# Altium schematic sheet Connector-Sheet.SchDoc
size 420 x 297 mm; SheetNumber: 25; SheetTotal: 25
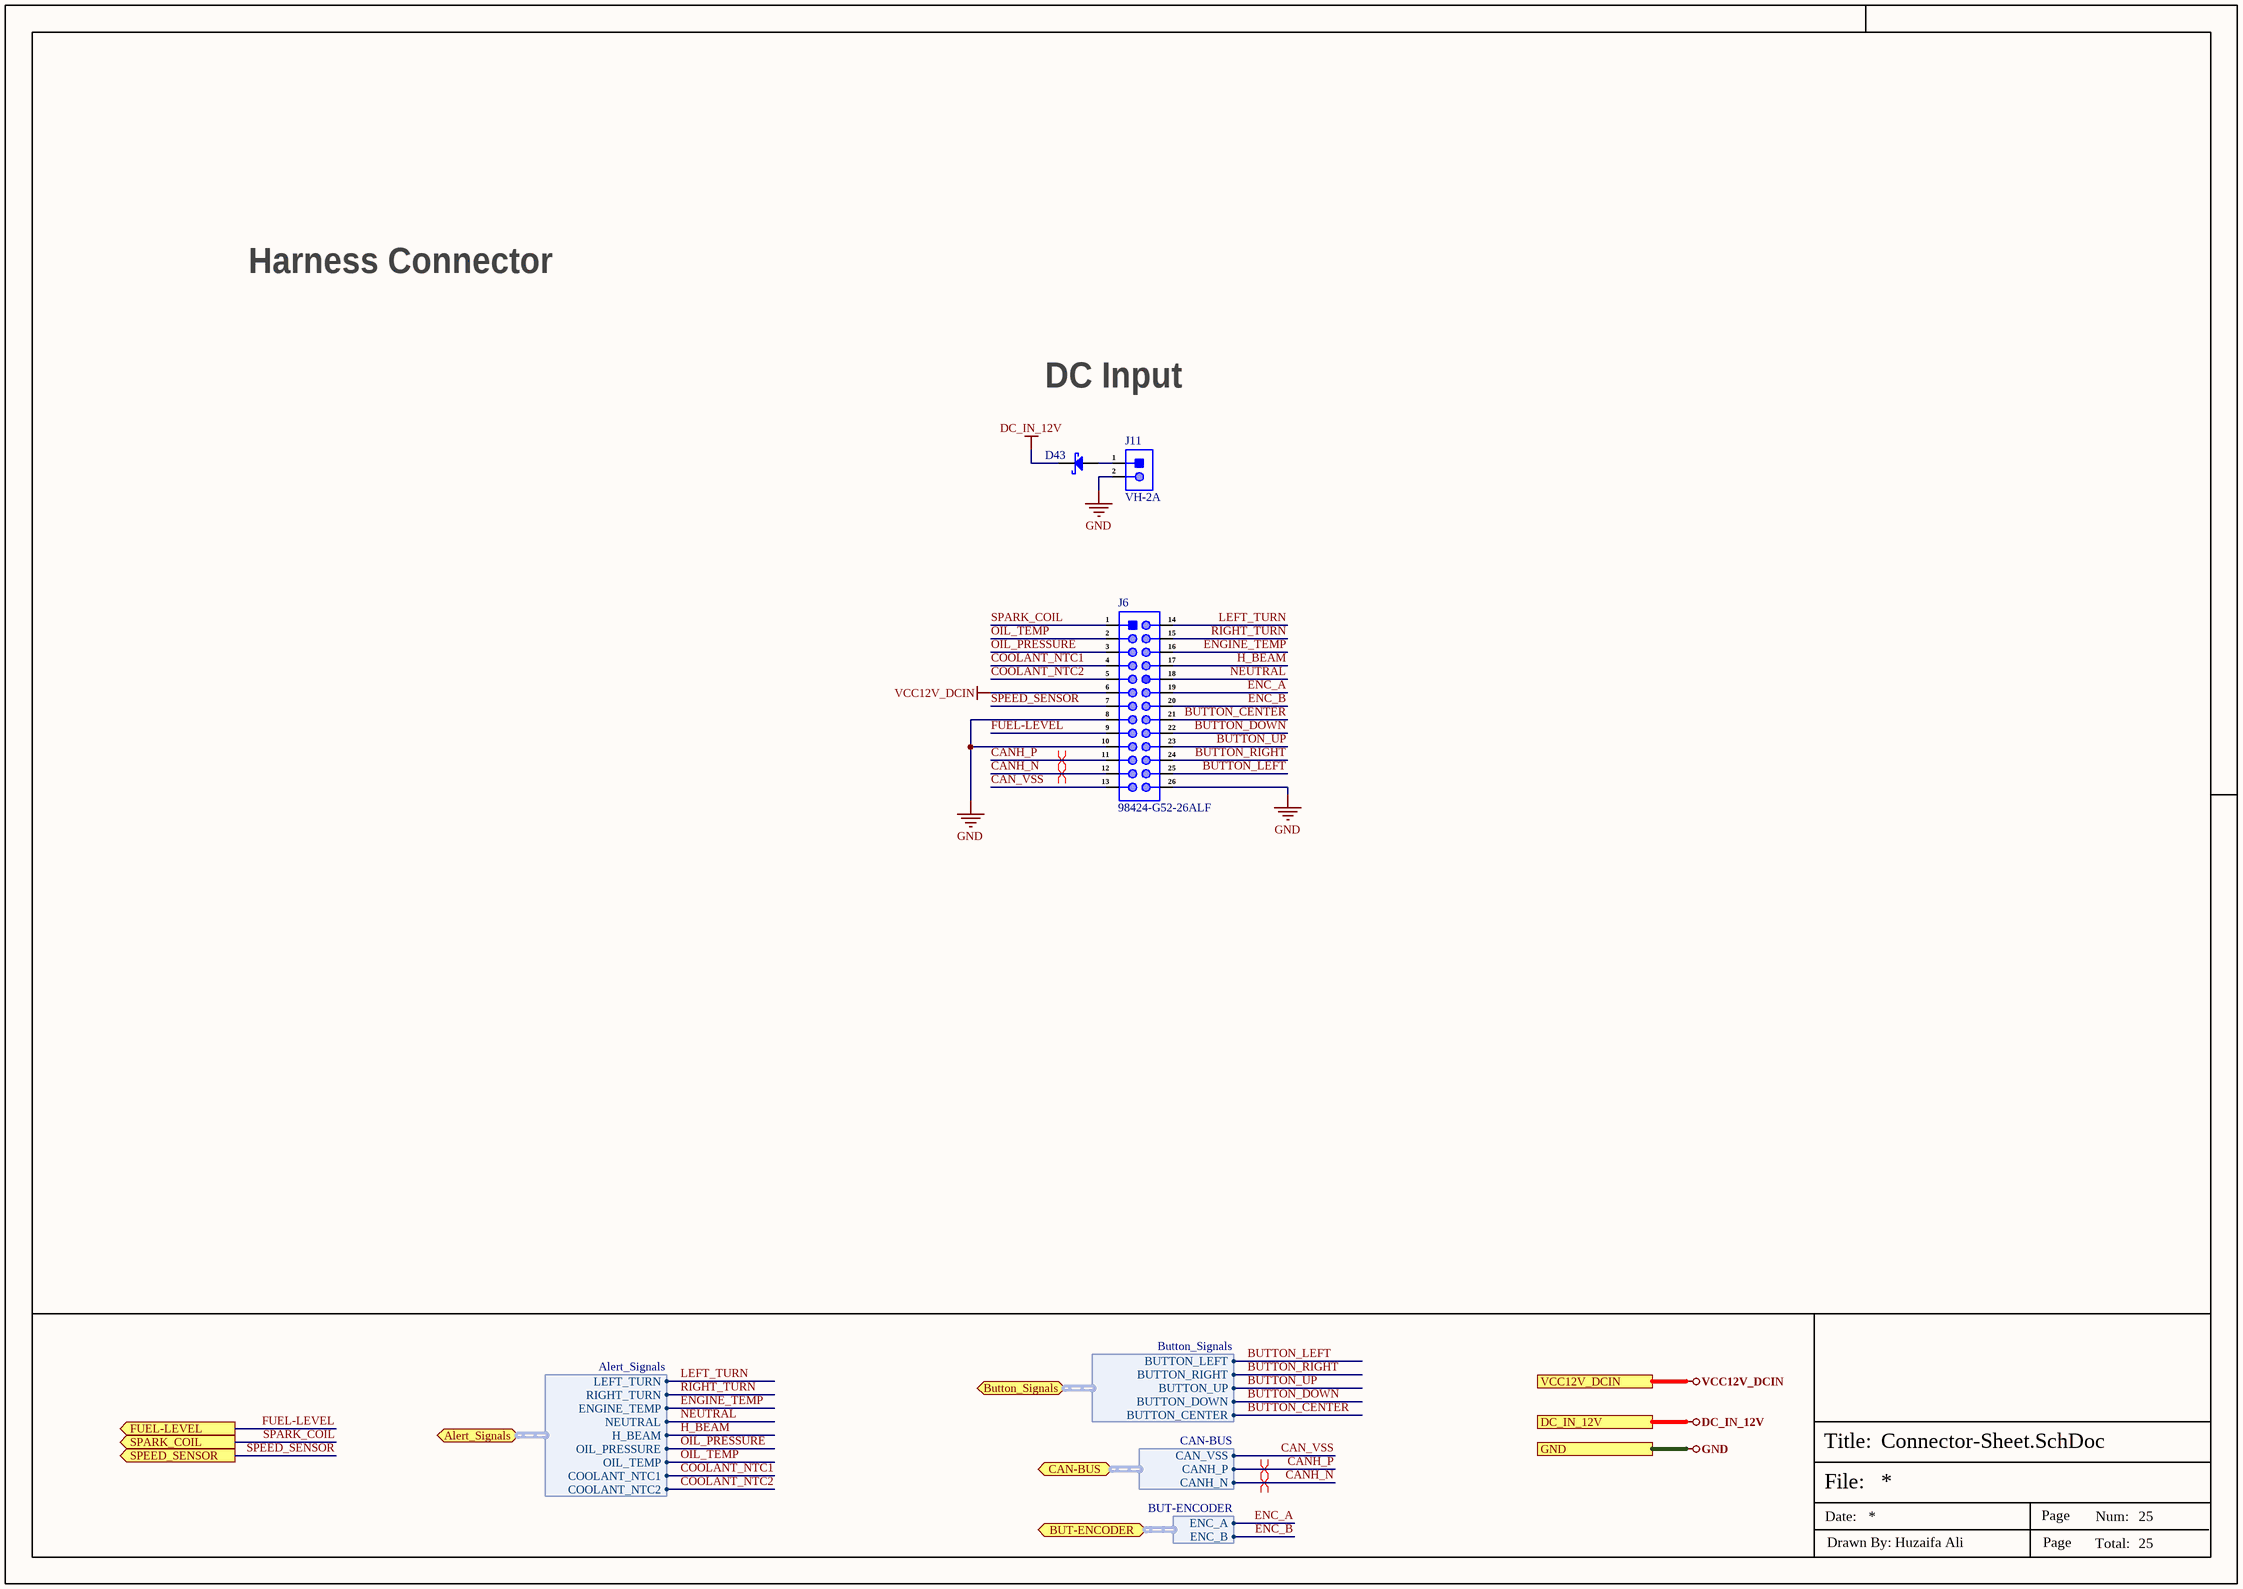
[diagram p0: Connector-Sheet.SchDoc]

## Parts
D43  SS34  [SMA]  (value not drawn)
J6  98424-G52-26ALF  [98424-G52-26ALF]
J11  VH-2A  [VH-2A]

## Ports
Alert_Signals (bidir, harness Alert_Signals, see Sensors-Sheet-2[1D]), BUT-ENCODER (bidir, harness BUT-ENCODER, see Sensors-Sheet-2[4D]), Button_Signals (bidir, harness Button_Signals, see Sensors-Sheet-2[2D]), CAN-BUS (bidir, harness CAN-BUS, see CAN-Bus-SPI-Flash-Sheet[4D]), DC_IN_12V (see Power-DC-IN-Sheet[4D]), FUEL-LEVEL (out, see Sensors-Sheet-1[3D]), GND (see CAN-Bus-SPI-Flash-Sheet[4D], DRAM-LPDDR4x-Sheet[4D], eMMC-Sheet[4D], LED-Debug-Sheet[4D], Power-DC-IN-Sheet[4D], Power-Others-Sheet[4D], Power-PMIC-Sheet[4D], RK3568-Audio-Interface[4D], RK3568-Flash-SD-Controller[4D], RK3568-OSC-PMUIO-Sheet[5D], RK3568-Power-Sheet[4D], RK3568-SARADC-GPIO[4D], RK3568-USB-PCIe-Sheet[5D], RK3568-VI-Interface-Sheet[4D], RK3568-VO-Interface-1[4D], RK3568-VO-Interface-2[4D], Sensors-Sheet-1[4D], Sensors-Sheet-2[5D], Type-C-Sheet[4D], USB-Ports[4D], VO-HDMI2.0-TX-Sheet[4D], VO-LCM-MIPI-DSI-TX0[4D], WIFI-BT-SDIO-Sheet[4D]), SPARK_COIL (out, see Sensors-Sheet-1[3D]), SPEED_SENSOR (out, see Sensors-Sheet-1[3D]), VCC12V_DCIN (see Power-DC-IN-Sheet[4D], Sensors-Sheet-1[4D], Sensors-Sheet-2[5D])

## Harnesses
Button_Signals: BUTTON_LEFT, BUTTON_RIGHT, BUTTON_UP, BUTTON_DOWN, BUTTON_CENTER
Alert_Signals: LEFT_TURN, RIGHT_TURN, ENGINE_TEMP, NEUTRAL, H_BEAM, OIL_PRESSURE, OIL_TEMP, COOLANT_NTC1, COOLANT_NTC2
CAN-BUS: CAN_VSS, CANH_P, CANH_N
BUT-ENCODER: ENC_A, ENC_B

## Nets
DC_IN_12V: D43.1(K) ; port DC_IN_12V
GND: J6.8 J6.10 J6.26 J11.2 ; port GND
VCC12V_DCIN: J6.6 ; port VCC12V_DCIN
BUTTON_CENTER: J6.21 ; port Button_Signals.BUTTON_CENTER
BUTTON_DOWN: J6.22 ; port Button_Signals.BUTTON_DOWN
BUTTON_LEFT: J6.25 ; port Button_Signals.BUTTON_LEFT
BUTTON_RIGHT: J6.24 ; port Button_Signals.BUTTON_RIGHT
BUTTON_UP: J6.23 ; port Button_Signals.BUTTON_UP
CAN_VSS: J6.13 ; port CAN-BUS.CAN_VSS
CANH_N: J6.12 ; port CAN-BUS.CANH_N
CANH_P: J6.11 ; port CAN-BUS.CANH_P
COOLANT_NTC1: J6.4 ; port Alert_Signals.COOLANT_NTC1
COOLANT_NTC2: J6.5 ; port Alert_Signals.COOLANT_NTC2
ENC_A: J6.19 ; port BUT-ENCODER.ENC_A
ENC_B: J6.20 ; port BUT-ENCODER.ENC_B
ENGINE_TEMP: J6.16 ; port Alert_Signals.ENGINE_TEMP
FUEL-LEVEL: J6.9 ; port FUEL-LEVEL
H_BEAM: J6.17 ; port Alert_Signals.H_BEAM
LEFT_TURN: J6.14 ; port Alert_Signals.LEFT_TURN
NEUTRAL: J6.18 ; port Alert_Signals.NEUTRAL
OIL_PRESSURE: J6.3 ; port Alert_Signals.OIL_PRESSURE
OIL_TEMP: J6.2 ; port Alert_Signals.OIL_TEMP
RIGHT_TURN: J6.15 ; port Alert_Signals.RIGHT_TURN
SPARK_COIL: J6.1 ; port SPARK_COIL
SPEED_SENSOR: J6.7 ; port SPEED_SENSOR
NetD43_2: D43.2(A) J11.1

## Layout directives
differential pair: CANH_N, CANH_P

## Notes on the sheet
- Harness Connector
- DC Input
- File:
- Title:
- Date:
- Page
- Num:
- Total:
- Drawn By: Huzaifa Ali

## Library data of the parts
D43 = SS34: 0.5mA@40V 40V Single 3A 0.55V@3A SMA(DO-214AC) Schottky Barrier Diodes (SBD) ROHS; Manufacturer: MDD; Item Type: Diode; Manufacturer Part Number: SS34; Package: SMA(DO-214AC); LCSC Part Number: C8678; ComponentLink1Description: LCSC; ComponentLink1URL: https://www.lcsc.com/product-detail/Schottky-Barrier-Diodes-SBD_MDD-Microdiode-Electronics-SS34_C8678.html
J6 = 98424-G52-26ALF: CONN HEADER SMD 26POS 2MM; Manufacturer: Amphenol ICC / FCI; Item Type: Headers and Wire Housings; Supplier: Avnet; Supplier Part Number: 65AC3204; Manufacturer Part Number: 98424-G52-26ALF; RoHS: Yes; Stock: 29; Pricing: 1=1.91 (USD); ComponentLink1URL: https://datasheet.ciiva.com/713/98424-713391.pdf?src-supplier=Digikey; ComponentLink1Description: https://datasheet.ciiva.com/713/98424-713391.pdf?src-supplier=Digikey; ComponentLink2URL: https://datasheet.ciiva.com/713/98424-713392.pdf?src-supplier=Digikey; ComponentLink2Description: https://datasheet.ciiva.com/713/98424-713392.pdf?src-supplier=Digikey; ComponentLink3URL: https://datasheet.ciiva.com/9473/98424-9473029.pdf?src-supplier=Avnet; ComponentLink3Description: https://datasheet.ciiva.com/9473/98424-9473029.pdf?src-supplier=Avnet; ComponentLink4URL: https://datasheet.ciiva.com/729/98424-729327.pdf?src-supplier=Digikey; ComponentLink4Description: https://datasheet.ciiva.com/729/98424-729327.pdf?src-supplier=Digikey; LCSC Part Number: C213188
J11 = VH-2A: 2.00mm Pitch MicroClasp Wire-to-Board Header, Dual Row, Vertical, 24 Circuits, with PCB Locator; Manufacturer: BOOMELE; Item Type: Wire To Board Connector; Manufacturer Part Number: VH-2A; Package: Push-Pull,P=3.96mm; LCSC Part Number: C80347; ComponentLink1Description: LCSC; ComponentLink1URL: https://www.lcsc.com/product-detail/Wire-To-Board-span-style-background-color-ff0-Connector-span_BOOMELE-Boom-Precision-Elec-VH-2A_C80347.html; Supplier: Mouser; Supplier Part Number: 538-55917-2410; RoHS: Yes; Category: Headers and Wire Housings; Stock: 3772; Pricing: 1=1.36, 10=1.15, 50=1.15, 100=1.03, 1000=0.849, 10000=0.66 (USD); ComponentLink2URL: https://datasheet.ciiva.com/5156/0559172410-pcb-headers-171124-5156321.pdf?src-supplier=Mouser; ComponentLink2Description: https://datasheet.ciiva.com/5156/0559172410-pcb-headers-171124-5156321.pdf?src-supplier=Mouser